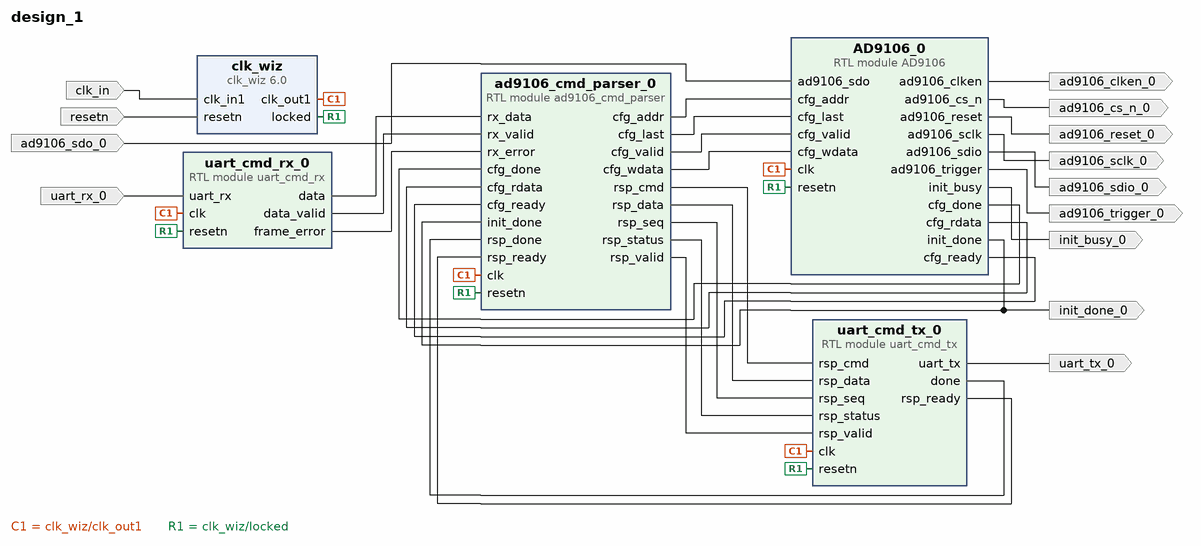
[diagram p0: block diagram of the top level]
# Vivado block design design_1, xc7a35tfgg484-2, Vivado 2023.2
create_bd_design design_1

create_bd_port -dir I ad9106_sdo_0
create_bd_port -dir O ad9106_sclk_0
create_bd_port -dir O ad9106_sdio_0
create_bd_port -dir O ad9106_cs_n_0
create_bd_port -dir O -type rst ad9106_reset_0
create_bd_port -dir O ad9106_trigger_0
create_bd_port -dir O ad9106_clken_0
create_bd_port -dir O init_done_0
create_bd_port -dir O init_busy_0
create_bd_port -dir I -type clk clk_in
set_property -dict {CONFIG.CLK_DOMAIN design_1_clk_in1_0 CONFIG.FREQ_HZ 50000000} [get_bd_ports clk_in]
create_bd_port -dir I -type rst resetn
create_bd_port -dir I uart_rx_0
create_bd_port -dir O uart_tx_0

create_bd_cell -type module -reference AD9106 AD9106_0
set_property -dict {CONFIG.DDS_TUNING_WORD 0x113D33 CONFIG.SRAM_HOLD 0001} [get_bd_cells AD9106_0]
create_bd_cell -type ip -vlnv xilinx.com:ip:clk_wiz:6.0 clk_wiz
set_property -dict [list \
  CONFIG.CLKIN1_JITTER_PS 200.0 \
  CONFIG.CLKOUT1_JITTER 162.035 \
  CONFIG.CLKOUT1_PHASE_ERROR 164.985 \
  CONFIG.CLKOUT1_REQUESTED_OUT_FREQ 100.000 \
  CONFIG.CLKOUT2_JITTER 130.958 \
  CONFIG.CLKOUT2_PHASE_ERROR 98.575 \
  CONFIG.CLKOUT2_USED false \
  CONFIG.MMCM_CLKFBOUT_MULT_F 20.000 \
  CONFIG.MMCM_CLKIN1_PERIOD 20.000 \
  CONFIG.MMCM_CLKIN2_PERIOD 10.0 \
  CONFIG.MMCM_CLKOUT0_DIVIDE_F 10.000 \
  CONFIG.MMCM_CLKOUT1_DIVIDE 1 \
  CONFIG.NUM_OUT_CLKS 1 \
  CONFIG.PRIM_IN_FREQ 50.000 \
  CONFIG.RESET_PORT resetn \
  CONFIG.RESET_TYPE ACTIVE_LOW \
] [get_bd_cells clk_wiz]
create_bd_cell -type module -reference uart_cmd_rx uart_cmd_rx_0
create_bd_cell -type module -reference uart_cmd_tx uart_cmd_tx_0
create_bd_cell -type module -reference ad9106_cmd_parser ad9106_cmd_parser_0

# ---- connections ----

connect_bd_net [get_bd_pins AD9106_0/ad9106_clken] [get_bd_ports ad9106_clken_0]
connect_bd_net [get_bd_pins AD9106_0/ad9106_cs_n] [get_bd_ports ad9106_cs_n_0]
connect_bd_net [get_bd_pins AD9106_0/ad9106_reset] [get_bd_ports ad9106_reset_0]
connect_bd_net [get_bd_pins AD9106_0/ad9106_sclk] [get_bd_ports ad9106_sclk_0]
connect_bd_net [get_bd_pins AD9106_0/ad9106_sdio] [get_bd_ports ad9106_sdio_0]
connect_bd_net [get_bd_pins AD9106_0/ad9106_trigger] [get_bd_ports ad9106_trigger_0]
connect_bd_net [get_bd_pins AD9106_0/cfg_done] [get_bd_pins ad9106_cmd_parser_0/cfg_done]
connect_bd_net [get_bd_pins AD9106_0/cfg_rdata] [get_bd_pins ad9106_cmd_parser_0/cfg_rdata]
connect_bd_net [get_bd_pins AD9106_0/cfg_ready] [get_bd_pins ad9106_cmd_parser_0/cfg_ready]
connect_bd_net [get_bd_pins AD9106_0/init_busy] [get_bd_ports init_busy_0]
connect_bd_net [get_bd_pins AD9106_0/init_done] [get_bd_ports init_done_0] [get_bd_pins ad9106_cmd_parser_0/init_done]
connect_bd_net [get_bd_pins ad9106_cmd_parser_0/cfg_addr] [get_bd_pins AD9106_0/cfg_addr]
connect_bd_net [get_bd_pins ad9106_cmd_parser_0/cfg_last] [get_bd_pins AD9106_0/cfg_last]
connect_bd_net [get_bd_pins ad9106_cmd_parser_0/cfg_valid] [get_bd_pins AD9106_0/cfg_valid]
connect_bd_net [get_bd_pins ad9106_cmd_parser_0/cfg_wdata] [get_bd_pins AD9106_0/cfg_wdata]
connect_bd_net [get_bd_pins ad9106_cmd_parser_0/rsp_cmd] [get_bd_pins uart_cmd_tx_0/rsp_cmd]
connect_bd_net [get_bd_pins ad9106_cmd_parser_0/rsp_data] [get_bd_pins uart_cmd_tx_0/rsp_data]
connect_bd_net [get_bd_pins ad9106_cmd_parser_0/rsp_seq] [get_bd_pins uart_cmd_tx_0/rsp_seq]
connect_bd_net [get_bd_pins ad9106_cmd_parser_0/rsp_status] [get_bd_pins uart_cmd_tx_0/rsp_status]
connect_bd_net [get_bd_pins ad9106_cmd_parser_0/rsp_valid] [get_bd_pins uart_cmd_tx_0/rsp_valid]
connect_bd_net -net ad9106_sdo_0_1 [get_bd_ports ad9106_sdo_0] [get_bd_pins AD9106_0/ad9106_sdo]
connect_bd_net [get_bd_ports clk_in] [get_bd_pins clk_wiz/clk_in1]
connect_bd_net [get_bd_pins clk_wiz/clk_out1] \
  [get_bd_pins uart_cmd_rx_0/clk] [get_bd_pins uart_cmd_tx_0/clk] [get_bd_pins AD9106_0/clk] \
  [get_bd_pins ad9106_cmd_parser_0/clk]
connect_bd_net [get_bd_pins clk_wiz/locked] \
  [get_bd_pins uart_cmd_rx_0/resetn] [get_bd_pins uart_cmd_tx_0/resetn] [get_bd_pins AD9106_0/resetn] \
  [get_bd_pins ad9106_cmd_parser_0/resetn]
connect_bd_net [get_bd_ports resetn] [get_bd_pins clk_wiz/resetn]
connect_bd_net [get_bd_pins uart_cmd_rx_0/data] [get_bd_pins ad9106_cmd_parser_0/rx_data]
connect_bd_net [get_bd_pins uart_cmd_rx_0/data_valid] [get_bd_pins ad9106_cmd_parser_0/rx_valid]
connect_bd_net [get_bd_pins uart_cmd_rx_0/frame_error] [get_bd_pins ad9106_cmd_parser_0/rx_error]
connect_bd_net [get_bd_pins uart_cmd_tx_0/done] [get_bd_pins ad9106_cmd_parser_0/rsp_done]
connect_bd_net [get_bd_pins uart_cmd_tx_0/rsp_ready] [get_bd_pins ad9106_cmd_parser_0/rsp_ready]
connect_bd_net [get_bd_pins uart_cmd_tx_0/uart_tx] [get_bd_ports uart_tx_0]
connect_bd_net -net uart_rx_0_1 [get_bd_ports uart_rx_0] [get_bd_pins uart_cmd_rx_0/uart_rx]

validate_bd_design
save_bd_design
